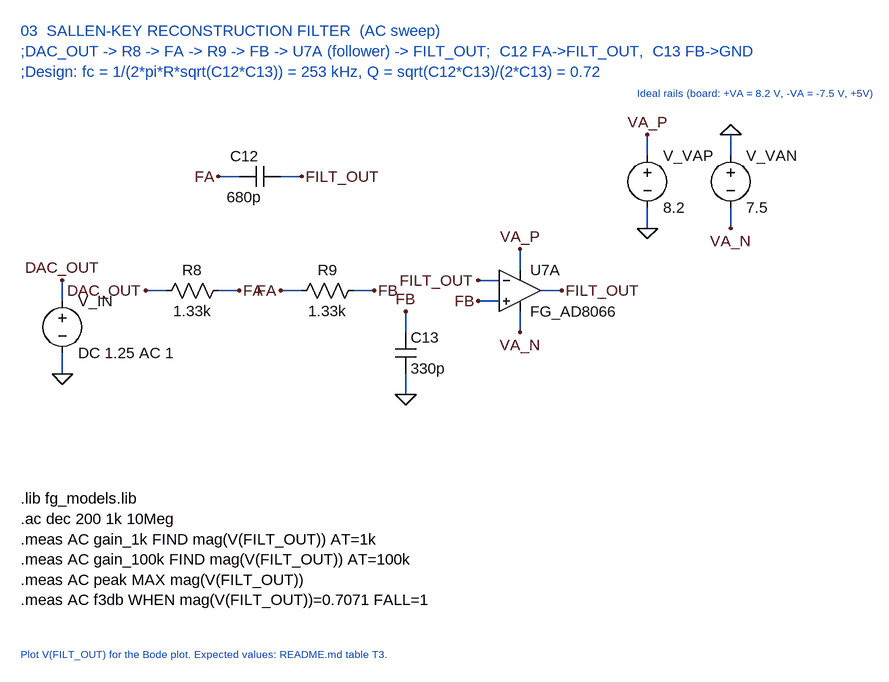
[diagram p0: schematic 03_filter_response.asc]
03_filter_response.asc, the LTspice schematic file:
Version 4
SHEET 1 2400 1600
WIRE 900 -240 900 -208
WIRE 900 -96 900 -128
WIRE 1028 -240 1028 -208
WIRE 1028 -96 1028 -128
WIRE 0 -16 0 16
WIRE 0 128 0 96
WIRE 272 0 240 0
WIRE 128 0 160 0
WIRE 480 0 448 0
WIRE 336 0 368 0
WIRE 368 -176 336 -176
WIRE 240 -176 272 -176
WIRE 528 32 528 64
WIRE 528 160 528 128
WIRE 640 16 672 16
WIRE 640 -16 672 -16
WIRE 704 -64 704 -32
WIRE 704 64 704 32
WIRE 768 0 736 0
FLAG 900 -240 VA_P
FLAG 900 -96 0
FLAG 1028 -240 0
FLAG 1028 -96 VA_N
FLAG 0 -16 DAC_OUT
FLAG 0 128 0
FLAG 272 0 FA
FLAG 128 0 DAC_OUT
FLAG 480 0 FB
FLAG 336 0 FA
FLAG 368 -176 FILT_OUT
FLAG 240 -176 FA
FLAG 528 32 FB
FLAG 528 160 0
FLAG 640 16 FB
FLAG 640 -16 FILT_OUT
FLAG 704 -64 VA_P
FLAG 704 64 VA_N
FLAG 768 0 FILT_OUT
TEXT -64 -400 Left 2 ;03  SALLEN-KEY RECONSTRUCTION FILTER  (AC sweep)\n;DAC_OUT -> R8 -> FA -> R9 -> FB -> U7A (follower) -> FILT_OUT;  C12 FA->FILT_OUT,  C13 FB->GND\n;Design: fc = 1/(2*pi*R*sqrt(C12*C13)) = 253 kHz, Q = sqrt(C12*C13)/(2*C13) = 0.72
SYMBOL voltage 900 -224 R0
SYMATTR InstName V_VAP
SYMATTR Value 8.2
SYMBOL voltage 1028 -224 R0
SYMATTR InstName V_VAN
SYMATTR Value 7.5
TEXT 884 -304 Left 1 ;Ideal rails (board: +VA = 8.2 V, -VA = -7.5 V, +5V)
SYMBOL voltage 0 0 R0
SYMATTR InstName V_IN
SYMATTR Value DC 1.25 AC 1
SYMBOL res 256 -16 R90
WINDOW 0 0 56 VBottom 2
WINDOW 3 32 56 VTop 2
SYMATTR InstName R8
SYMATTR Value 1.33k
SYMBOL res 464 -16 R90
WINDOW 0 0 56 VBottom 2
WINDOW 3 32 56 VTop 2
SYMATTR InstName R9
SYMATTR Value 1.33k
SYMBOL cap 336 -192 R90
WINDOW 0 0 56 VBottom 2
WINDOW 3 32 56 VTop 2
SYMATTR InstName C12
SYMATTR Value 680p
SYMBOL cap 512 64 R0
SYMATTR InstName C13
SYMATTR Value 330p
SYMBOL OpAmps\\opamp2 704 -64 R0
SYMATTR InstName U7A
SYMATTR Value FG_AD8066
TEXT -64 320 Left 2 !.lib fg_models.lib\n.ac dec 200 1k 10Meg\n.meas AC gain_1k FIND mag(V(FILT_OUT)) AT=1k\n.meas AC gain_100k FIND mag(V(FILT_OUT)) AT=100k\n.meas AC peak MAX mag(V(FILT_OUT))\n.meas AC f3db WHEN mag(V(FILT_OUT))=0.7071 FALL=1
TEXT -64 560 Left 1 ;Plot V(FILT_OUT) for the Bode plot. Expected values: README.md table T3.

The netlist it stands for:
* 03_filter_response.asc
V_VAP VA_P 0 8.2
V_VAN 0 VA_N 7.5
V_IN DAC_OUT 0 DC 1.25 AC 1
R8 FA DAC_OUT 1.33k
R9 FB FA 1.33k
C12 FILT_OUT FA 680p
C13 FB 0 330p
XU7A FB FILT_OUT VA_P VA_N FILT_OUT FG_AD8066  ; pins In+ In- V+ V- OUT
* 03  SALLEN-KEY RECONSTRUCTION FILTER  (AC sweep)
* ;DAC_OUT -> R8 -> FA -> R9 -> FB -> U7A (follower) -> FILT_OUT;  C12 FA->FILT_OUT,  C13 FB->GND
* ;Design: fc = 1/(2*pi*R*sqrt(C12*C13)) = 253 kHz, Q = sqrt(C12*C13)/(2*C13) = 0.72
* Ideal rails (board: +VA = 8.2 V, -VA = -7.5 V, +5V)
.lib fg_models.lib
.ac dec 200 1k 10Meg
.meas AC gain_1k FIND mag(V(FILT_OUT)) AT=1k
.meas AC gain_100k FIND mag(V(FILT_OUT)) AT=100k
.meas AC peak MAX mag(V(FILT_OUT))
.meas AC f3db WHEN mag(V(FILT_OUT))=0.7071 FALL=1
* Plot V(FILT_OUT) for the Bode plot. Expected values: README.md table T3.
.backanno
.end